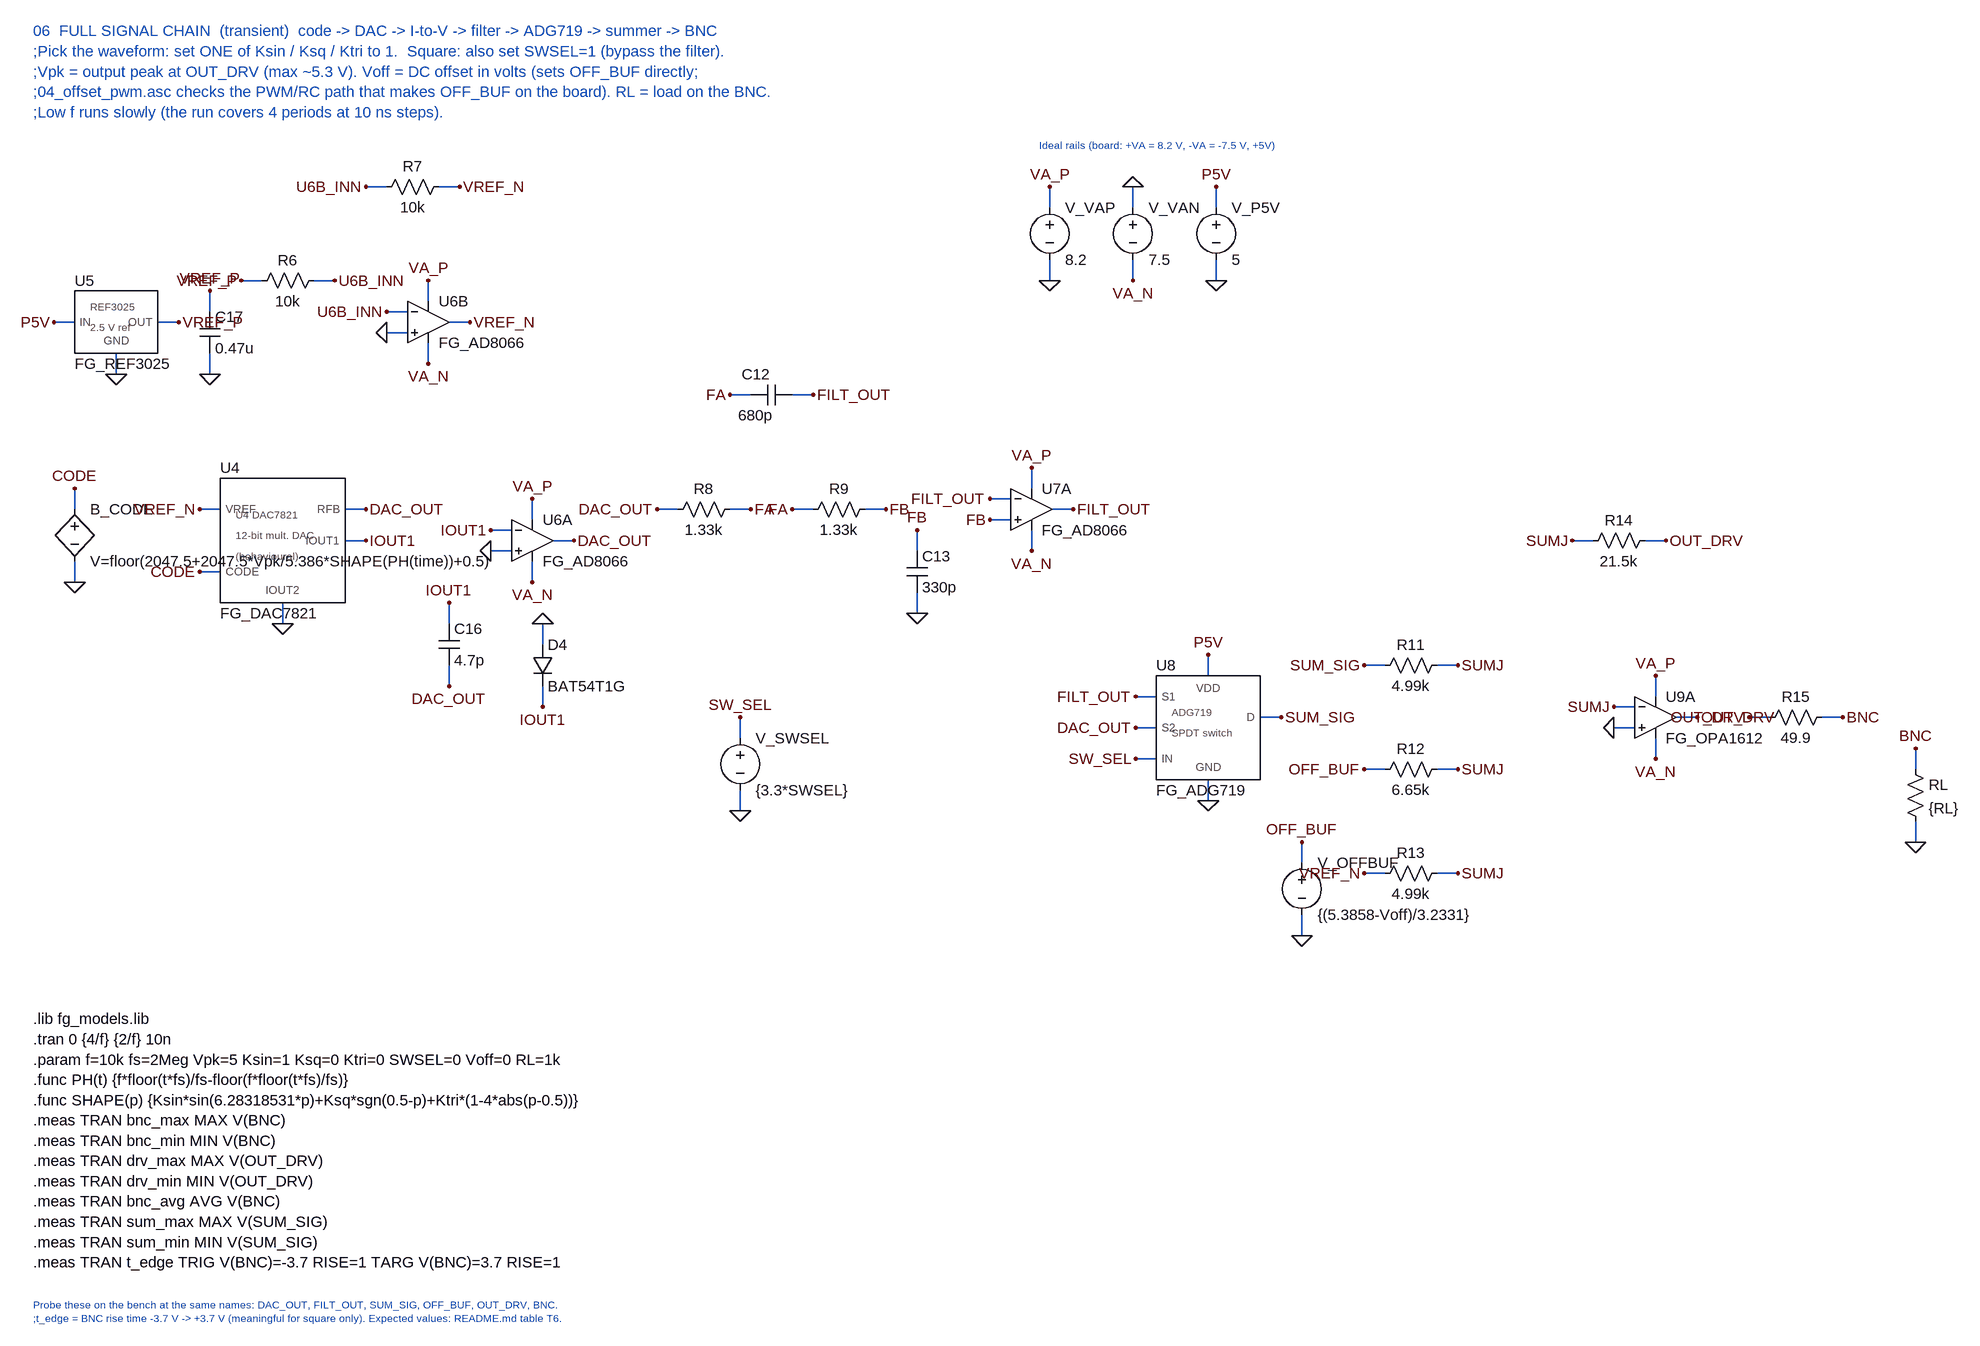
[diagram p0: schematic 06_full_chain.asc]
06_full_chain.asc, the LTspice schematic file:
Version 4
SHEET 1 2400 1600
WIRE 1500 -320 1500 -288
WIRE 1500 -176 1500 -208
WIRE 1628 -320 1628 -288
WIRE 1628 -176 1628 -208
WIRE 1756 -320 1756 -288
WIRE 1756 -176 1756 -208
WIRE -32 -112 0 -112
WIRE 64 -32 64 -64
WIRE 160 -112 128 -112
WIRE 208 -160 208 -128
WIRE 208 -32 208 -64
WIRE 400 -176 368 -176
WIRE 256 -176 288 -176
WIRE 480 -96 512 -96
WIRE 480 -128 512 -128
WIRE 544 -176 544 -144
WIRE 544 -48 544 -80
WIRE 608 -112 576 -112
WIRE 592 -320 560 -320
WIRE 448 -320 480 -320
WIRE 0 144 0 176
WIRE 0 288 0 256
WIRE 192 176 224 176
WIRE 448 224 416 224
WIRE 320 352 320 320
WIRE 448 176 416 176
WIRE 192 272 224 272
WIRE 640 240 672 240
WIRE 640 208 672 208
WIRE 704 160 704 192
WIRE 704 288 704 256
WIRE 768 224 736 224
WIRE 576 320 576 352
WIRE 576 448 576 416
WIRE 720 352 720 384
WIRE 720 480 720 448
WIRE 1040 176 1008 176
WIRE 896 176 928 176
WIRE 1248 176 1216 176
WIRE 1104 176 1136 176
WIRE 1136 0 1104 0
WIRE 1008 0 1040 0
WIRE 1296 208 1296 240
WIRE 1296 336 1296 304
WIRE 1408 192 1440 192
WIRE 1408 160 1440 160
WIRE 1472 112 1472 144
WIRE 1472 240 1472 208
WIRE 1536 176 1504 176
WIRE 1024 496 1024 528
WIRE 1024 640 1024 608
WIRE 1632 560 1664 560
WIRE 1744 400 1744 432
WIRE 1744 624 1744 592
WIRE 1632 464 1664 464
WIRE 1856 496 1824 496
WIRE 1632 512 1664 512
WIRE 1888 688 1888 720
WIRE 1888 832 1888 800
WIRE 2128 416 2096 416
WIRE 1984 416 2016 416
WIRE 2128 576 2096 576
WIRE 1984 576 2016 576
WIRE 2128 736 2096 736
WIRE 1984 736 2016 736
WIRE 2448 224 2416 224
WIRE 2304 224 2336 224
WIRE 2368 512 2400 512
WIRE 2368 480 2400 480
WIRE 2432 432 2432 464
WIRE 2432 560 2432 528
WIRE 2496 496 2464 496
WIRE 2720 496 2688 496
WIRE 2576 496 2608 496
WIRE 2832 544 2832 576
WIRE 2832 688 2832 656
FLAG 1500 -320 VA_P
FLAG 1500 -176 0
FLAG 1628 -320 0
FLAG 1628 -176 VA_N
FLAG 1756 -320 P5V
FLAG 1756 -176 0
FLAG -32 -112 P5V
FLAG 64 -32 0
FLAG 160 -112 VREF_P
FLAG 208 -160 VREF_P
FLAG 208 -32 0
FLAG 400 -176 U6B_INN
FLAG 256 -176 VREF_P
FLAG 480 -96 0
FLAG 480 -128 U6B_INN
FLAG 544 -176 VA_P
FLAG 544 -48 VA_N
FLAG 608 -112 VREF_N
FLAG 592 -320 VREF_N
FLAG 448 -320 U6B_INN
FLAG 0 144 CODE
FLAG 0 288 0
FLAG 192 176 VREF_N
FLAG 448 224 IOUT1
FLAG 320 352 0
FLAG 448 176 DAC_OUT
FLAG 192 272 CODE
FLAG 640 240 0
FLAG 640 208 IOUT1
FLAG 704 160 VA_P
FLAG 704 288 VA_N
FLAG 768 224 DAC_OUT
FLAG 576 320 IOUT1
FLAG 576 448 DAC_OUT
FLAG 720 352 0
FLAG 720 480 IOUT1
FLAG 1040 176 FA
FLAG 896 176 DAC_OUT
FLAG 1248 176 FB
FLAG 1104 176 FA
FLAG 1136 0 FILT_OUT
FLAG 1008 0 FA
FLAG 1296 208 FB
FLAG 1296 336 0
FLAG 1408 192 FB
FLAG 1408 160 FILT_OUT
FLAG 1472 112 VA_P
FLAG 1472 240 VA_N
FLAG 1536 176 FILT_OUT
FLAG 1024 496 SW_SEL
FLAG 1024 640 0
FLAG 1632 560 SW_SEL
FLAG 1744 400 P5V
FLAG 1744 624 0
FLAG 1632 464 FILT_OUT
FLAG 1856 496 SUM_SIG
FLAG 1632 512 DAC_OUT
FLAG 1888 688 OFF_BUF
FLAG 1888 832 0
FLAG 2128 416 SUMJ
FLAG 1984 416 SUM_SIG
FLAG 2128 576 SUMJ
FLAG 1984 576 OFF_BUF
FLAG 2128 736 SUMJ
FLAG 1984 736 VREF_N
FLAG 2448 224 OUT_DRV
FLAG 2304 224 SUMJ
FLAG 2368 512 0
FLAG 2368 480 SUMJ
FLAG 2432 432 VA_P
FLAG 2432 560 VA_N
FLAG 2496 496 OUT_DRV
FLAG 2720 496 BNC
FLAG 2576 496 OUT_DRV
FLAG 2832 544 BNC
FLAG 2832 688 0
TEXT -64 -560 Left 2 ;06  FULL SIGNAL CHAIN  (transient)  code -> DAC -> I-to-V -> filter -> ADG719 -> summer -> BNC\n;Pick the waveform: set ONE of Ksin / Ksq / Ktri to 1.  Square: also set SWSEL=1 (bypass the filter).\n;Vpk = output peak at OUT_DRV (max ~5.3 V). Voff = DC offset in volts (sets OFF_BUF directly;\n;04_offset_pwm.asc checks the PWM/RC path that makes OFF_BUF on the board). RL = load on the BNC.\n;Low f runs slowly (the run covers 4 periods at 10 ns steps).
SYMBOL voltage 1500 -304 R0
SYMATTR InstName V_VAP
SYMATTR Value 8.2
SYMBOL voltage 1628 -304 R0
SYMATTR InstName V_VAN
SYMATTR Value 7.5
SYMBOL voltage 1756 -304 R0
SYMATTR InstName V_P5V
SYMATTR Value 5
TEXT 1484 -384 Left 1 ;Ideal rails (board: +VA = 8.2 V, -VA = -7.5 V, +5V)
SYMBOL FG_REF3025 0 -160 R0
SYMATTR InstName U5
SYMATTR Value FG_REF3025
SYMBOL cap 192 -128 R0
SYMATTR InstName C17
SYMATTR Value 0.47u
SYMBOL res 384 -192 R90
WINDOW 0 0 56 VBottom 2
WINDOW 3 32 56 VTop 2
SYMATTR InstName R6
SYMATTR Value 10k
SYMBOL OpAmps\\opamp2 544 -176 R0
SYMATTR InstName U6B
SYMATTR Value FG_AD8066
SYMBOL res 576 -336 R90
WINDOW 0 0 56 VBottom 2
WINDOW 3 32 56 VTop 2
SYMATTR InstName R7
SYMATTR Value 10k
SYMBOL bv 0 160 R0
SYMATTR InstName B_CODE
SYMATTR Value V=floor(2047.5+2047.5*Vpk/5.386*SHAPE(PH(time))+0.5)
SYMBOL FG_DAC7821 224 128 R0
SYMATTR InstName U4
SYMATTR Value FG_DAC7821
SYMBOL OpAmps\\opamp2 704 160 R0
SYMATTR InstName U6A
SYMATTR Value FG_AD8066
SYMBOL cap 560 352 R0
SYMATTR InstName C16
SYMATTR Value 4.7p
SYMBOL diode 704 384 R0
SYMATTR InstName D4
SYMATTR Value BAT54T1G
SYMBOL res 1024 160 R90
WINDOW 0 0 56 VBottom 2
WINDOW 3 32 56 VTop 2
SYMATTR InstName R8
SYMATTR Value 1.33k
SYMBOL res 1232 160 R90
WINDOW 0 0 56 VBottom 2
WINDOW 3 32 56 VTop 2
SYMATTR InstName R9
SYMATTR Value 1.33k
SYMBOL cap 1104 -16 R90
WINDOW 0 0 56 VBottom 2
WINDOW 3 32 56 VTop 2
SYMATTR InstName C12
SYMATTR Value 680p
SYMBOL cap 1280 240 R0
SYMATTR InstName C13
SYMATTR Value 330p
SYMBOL OpAmps\\opamp2 1472 112 R0
SYMATTR InstName U7A
SYMATTR Value FG_AD8066
SYMBOL voltage 1024 512 R0
SYMATTR InstName V_SWSEL
SYMATTR Value {3.3*SWSEL}
SYMBOL FG_ADG719 1664 432 R0
SYMATTR InstName U8
SYMATTR Value FG_ADG719
SYMBOL voltage 1888 704 R0
SYMATTR InstName V_OFFBUF
SYMATTR Value {(5.3858-Voff)/3.2331}
SYMBOL res 2112 400 R90
WINDOW 0 0 56 VBottom 2
WINDOW 3 32 56 VTop 2
SYMATTR InstName R11
SYMATTR Value 4.99k
SYMBOL res 2112 560 R90
WINDOW 0 0 56 VBottom 2
WINDOW 3 32 56 VTop 2
SYMATTR InstName R12
SYMATTR Value 6.65k
SYMBOL res 2112 720 R90
WINDOW 0 0 56 VBottom 2
WINDOW 3 32 56 VTop 2
SYMATTR InstName R13
SYMATTR Value 4.99k
SYMBOL res 2432 208 R90
WINDOW 0 0 56 VBottom 2
WINDOW 3 32 56 VTop 2
SYMATTR InstName R14
SYMATTR Value 21.5k
SYMBOL OpAmps\\opamp2 2432 432 R0
SYMATTR InstName U9A
SYMATTR Value FG_OPA1612
SYMBOL res 2704 480 R90
WINDOW 0 0 56 VBottom 2
WINDOW 3 32 56 VTop 2
SYMATTR InstName R15
SYMATTR Value 49.9
SYMBOL res 2816 560 R0
SYMATTR InstName RL
SYMATTR Value {RL}
TEXT -64 960 Left 2 !.lib fg_models.lib\n.tran 0 {4/f} {2/f} 10n\n.param f=10k fs=2Meg Vpk=5 Ksin=1 Ksq=0 Ktri=0 SWSEL=0 Voff=0 RL=1k\n.func PH(t) {f*floor(t*fs)/fs-floor(f*floor(t*fs)/fs)}\n.func SHAPE(p) {Ksin*sin(6.28318531*p)+Ksq*sgn(0.5-p)+Ktri*(1-4*abs(p-0.5))}\n.meas TRAN bnc_max MAX V(BNC)\n.meas TRAN bnc_min MIN V(BNC)\n.meas TRAN drv_max MAX V(OUT_DRV)\n.meas TRAN drv_min MIN V(OUT_DRV)\n.meas TRAN bnc_avg AVG V(BNC)\n.meas TRAN sum_max MAX V(SUM_SIG)\n.meas TRAN sum_min MIN V(SUM_SIG)\n.meas TRAN t_edge TRIG V(BNC)=-3.7 RISE=1 TARG V(BNC)=3.7 RISE=1
TEXT -64 1400 Left 1 ;Probe these on the bench at the same names: DAC_OUT, FILT_OUT, SUM_SIG, OFF_BUF, OUT_DRV, BNC.\n;t_edge = BNC rise time -3.7 V -> +3.7 V (meaningful for square only). Expected values: README.md table T6.

The netlist it stands for:
* 06_full_chain.asc
V_VAP VA_P 0 8.2
V_VAN 0 VA_N 7.5
V_P5V P5V 0 5
XU5 P5V 0 VREF_P FG_REF3025 FG_REF3025  ; pins IN GND OUT
C17 VREF_P 0 0.47u
R6 U6B_INN VREF_P 10k
XU6B 0 U6B_INN VA_P VA_N VREF_N FG_AD8066  ; pins In+ In- V+ V- OUT
R7 VREF_N U6B_INN 10k
B_CODE CODE 0 V=floor(2047.5+2047.5*Vpk/5.386*SHAPE(PH(time))+0.5)
XU4 VREF_N IOUT1 0 DAC_OUT CODE FG_DAC7821 FG_DAC7821  ; pins VREF IOUT1 IOUT2 RFB CODE
XU6A 0 IOUT1 VA_P VA_N DAC_OUT FG_AD8066  ; pins In+ In- V+ V- OUT
C16 IOUT1 DAC_OUT 4.7p
D4 0 IOUT1 BAT54T1G
R8 FA DAC_OUT 1.33k
R9 FB FA 1.33k
C12 FILT_OUT FA 680p
C13 FB 0 330p
XU7A FB FILT_OUT VA_P VA_N FILT_OUT FG_AD8066  ; pins In+ In- V+ V- OUT
V_SWSEL SW_SEL 0 {3.3*SWSEL}
XU8 SW_SEL P5V 0 FILT_OUT SUM_SIG DAC_OUT FG_ADG719 FG_ADG719  ; pins IN VDD GND S1 D S2
V_OFFBUF OFF_BUF 0 {(5.3858-Voff)/3.2331}
R11 SUMJ SUM_SIG 4.99k
R12 SUMJ OFF_BUF 6.65k
R13 SUMJ VREF_N 4.99k
R14 OUT_DRV SUMJ 21.5k
XU9A 0 SUMJ VA_P VA_N OUT_DRV FG_OPA1612  ; pins In+ In- V+ V- OUT
R15 BNC OUT_DRV 49.9
RL BNC 0 {RL}
.model D D
.lib standard.dio
* 06  FULL SIGNAL CHAIN  (transient)  code -> DAC -> I-to-V -> filter -> ADG719 -> summer -> BNC
* ;Pick the waveform: set ONE of Ksin / Ksq / Ktri to 1.  Square: also set SWSEL=1 (bypass the filter).
* ;Vpk = output peak at OUT_DRV (max ~5.3 V). Voff = DC offset in volts (sets OFF_BUF directly;
* ;04_offset_pwm.asc checks the PWM/RC path that makes OFF_BUF on the board). RL = load on the BNC.
* ;Low f runs slowly (the run covers 4 periods at 10 ns steps).
* Ideal rails (board: +VA = 8.2 V, -VA = -7.5 V, +5V)
.lib fg_models.lib
.tran 0 {4/f} {2/f} 10n
.param f=10k fs=2Meg Vpk=5 Ksin=1 Ksq=0 Ktri=0 SWSEL=0 Voff=0 RL=1k
.func PH(t) {f*floor(t*fs)/fs-floor(f*floor(t*fs)/fs)}
.func SHAPE(p) {Ksin*sin(6.28318531*p)+Ksq*sgn(0.5-p)+Ktri*(1-4*abs(p-0.5))}
.meas TRAN bnc_max MAX V(BNC)
.meas TRAN bnc_min MIN V(BNC)
.meas TRAN drv_max MAX V(OUT_DRV)
.meas TRAN drv_min MIN V(OUT_DRV)
.meas TRAN bnc_avg AVG V(BNC)
.meas TRAN sum_max MAX V(SUM_SIG)
.meas TRAN sum_min MIN V(SUM_SIG)
.meas TRAN t_edge TRIG V(BNC)=-3.7 RISE=1 TARG V(BNC)=3.7 RISE=1
* Probe these on the bench at the same names: DAC_OUT, FILT_OUT, SUM_SIG, OFF_BUF, OUT_DRV, BNC.
* ;t_edge = BNC rise time -3.7 V -> +3.7 V (meaningful for square only). Expected values: README.md table T6.
.backanno
.end